# Altium schematic sheet Top_Sheet.SchDoc
size A4; DocumentNumber: 8; SheetNumber: 1; SheetTotal: 8
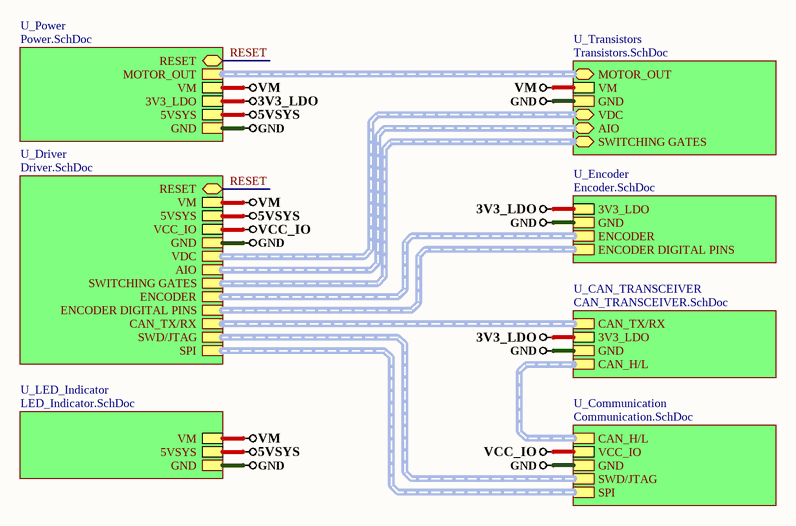
[diagram p0: Top_Sheet.SchDoc]

## Sub-sheets
U_CAN_TRANSCEIVER = CAN_TRANSCEIVER.SchDoc: CAN_H/L (harness CAN_H/L), CAN_TX/RX (harness CAN_TXRX), GND, 3V3_LDO
U_Communication = Communication.SchDoc: SWD/JTAG (harness SWD/JTAG), SPI (harness SPI), GND, VCC_IO, CAN_H/L (harness CAN_H/L)
U_Driver = Driver.SchDoc: SWITCHING GATES (harness SWITCHING GATES), AIO (harness AIO), GND, SWD/JTAG (harness SWD/JTAG), CAN_TX/RX (harness CAN_TX/RX), VCC_IO, VDC (harness VDC), 5VSYS, VM, RESET (bidir), SPI (harness SPI), ENCODER (harness ENCODER), ENCODER DIGITAL PINS (harness ENCODER DIGITAL PINS)
U_Encoder = Encoder.SchDoc: GND, 3V3_LDO, ENCODER (harness ENCODER), ENCODER DIGITAL PINS (harness ENCODER DIGITAL PINS)
U_LED_Indicator = LED_Indicator.SchDoc: 5VSYS, GND, VM
U_Power = Power.SchDoc: GND, VM, MOTOR_OUT (harness MOTOR_OUT), RESET (bidir), 3V3_LDO, 5VSYS
U_Transistors = Transistors.SchDoc: MOTOR_OUT (bidir, harness MOTOR_OUT), VDC (bidir, harness VDC), GND, VM, AIO (bidir, harness AIO), SWITCHING GATES (bidir, harness SWITCHING GATES)

## Nets
3V3_LDO: sheet U_CAN_TRANSCEIVER/3V3_LDO, sheet U_Power/3V3_LDO, sheet U_Encoder/3V3_LDO
5VSYS: sheet U_LED_Indicator/5VSYS, sheet U_Power/5VSYS, sheet U_Driver/5VSYS
GND: sheet U_Communication/GND, sheet U_LED_Indicator/GND, sheet U_Transistors/GND, sheet U_CAN_TRANSCEIVER/GND, sheet U_Power/GND, sheet U_Encoder/GND, sheet U_Driver/GND
VCC_IO: sheet U_Communication/VCC_IO, sheet U_Driver/VCC_IO
VM: sheet U_LED_Indicator/VM, sheet U_Transistors/VM, sheet U_Power/VM, sheet U_Driver/VM
RESET: sheet U_Power/RESET, sheet U_Driver/RESET

## Buses and harness runs
harness sheet U_CAN_TRANSCEIVER/CAN_H/L = sheet U_Communication/CAN_H/L
harness sheet U_CAN_TRANSCEIVER/CAN_TX/RX = sheet U_Driver/CAN_TX/RX
harness sheet U_Communication/SPI = sheet U_Driver/SPI
harness sheet U_Communication/SWD/JTAG = sheet U_Driver/SWD/JTAG
harness sheet U_Driver/AIO = sheet U_Transistors/AIO
harness sheet U_Driver/ENCODER = sheet U_Encoder/ENCODER
harness sheet U_Driver/ENCODER DIGITAL PINS = sheet U_Encoder/ENCODER DIGITAL PINS
harness sheet U_Driver/SWITCHING GATES = sheet U_Transistors/SWITCHING GATES
harness sheet U_Driver/VDC = sheet U_Transistors/VDC
harness sheet U_Power/MOTOR_OUT = sheet U_Transistors/MOTOR_OUT

## Notes on the sheet
- File:
- Title:
- Date:
- Page
- Num:
- Total:
- Drawn By: Huzaifa Ali